# Altium schematic sheet ESP32.SchDoc
size A4; SheetNumber: 7; SheetTotal: 7
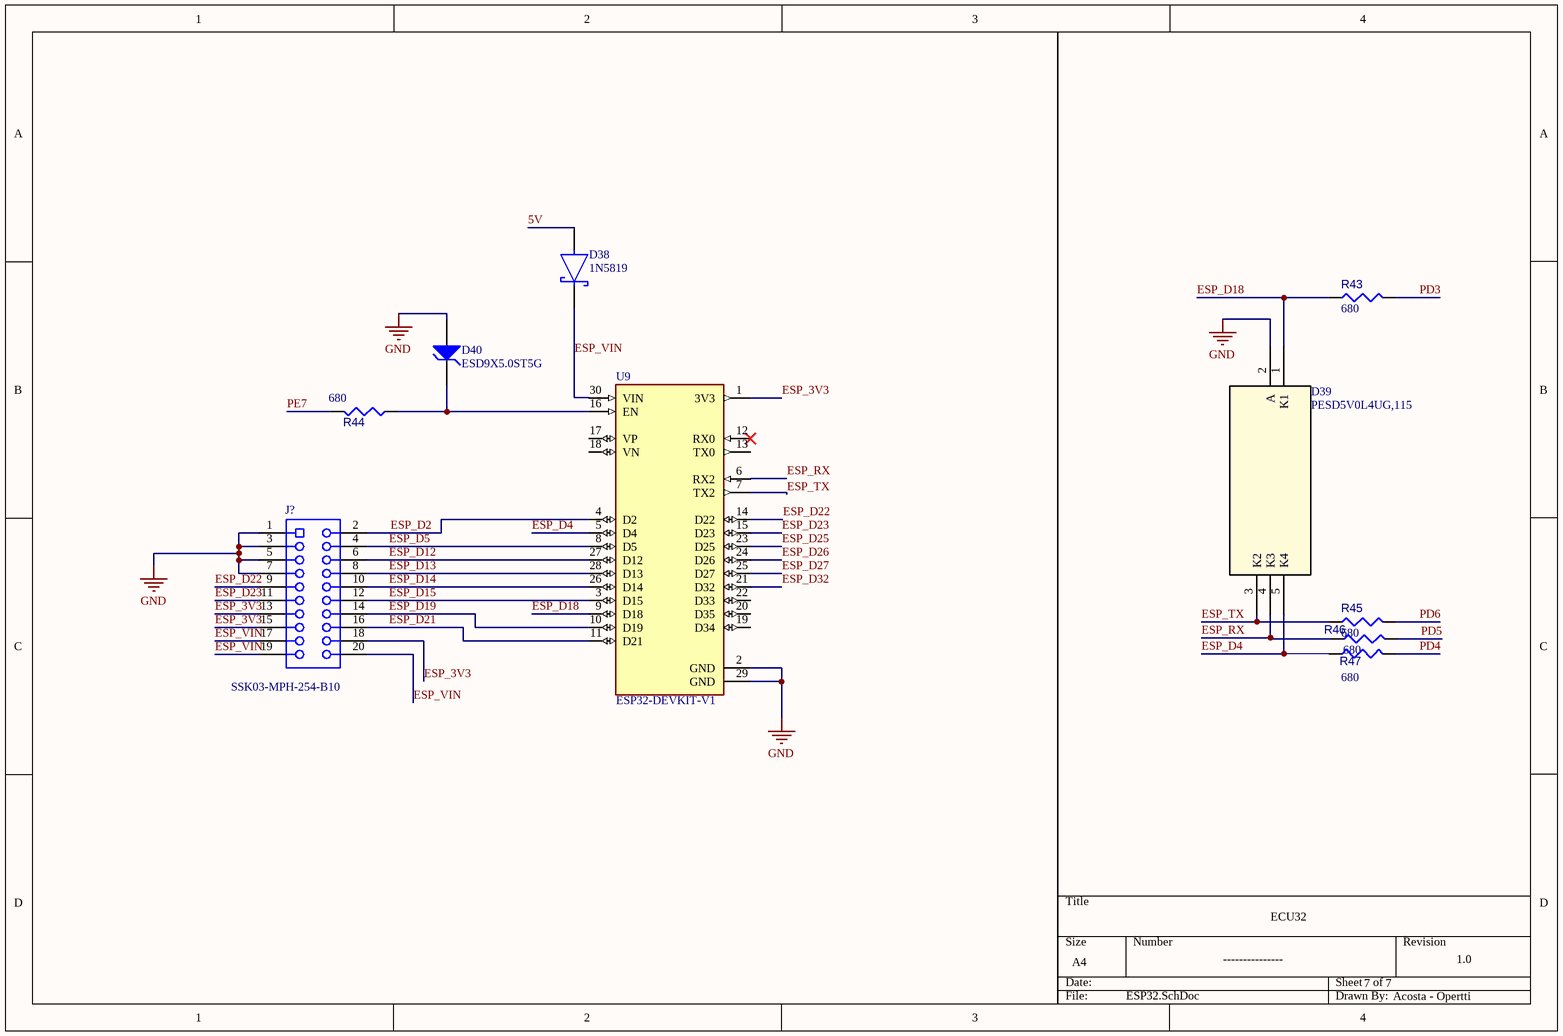
[diagram p0: ESP32.SchDoc]

## Parts
D38  1N5819  [FP-SMA-MFG]
D39  PESD5V0L4UG,115  [PESD5V0L4UG,115-Footprint-1]
D40  ESD9X5.0ST5G  [ONSC-SOD-923-2-514AA-01_V]
J?  SSK03-MPH-254-B10  [SAMESKY_SSK03-MPH-254-B10]
R43  value 680  [RESA60-630X240]  (hidden comment: MFR-25FBF52-47R5)
R44  value 680  [RESA60-630X240]  (hidden comment: MFR-25FBF52-47R5)
R45  value 680  [RESA60-630X240]  (hidden comment: MFR-25FBF52-47R5)
R46  value 680  [RESA60-630X240]  (hidden comment: MFR-25FBF52-47R5)
R47  value 680  [RESA60-630X240]  (hidden comment: MFR-25FBF52-47R5)
U9  ESP32-DEVKIT-V1  [MODULE_ESP32_DEVKIT_V1]

## Nets
GND: D39.2(A) D40.2(A) J?.1 J?.3 J?.5 J?.7 U9.2(GND) U9.29(GND)
5V: D38.2(A)
ESP_3V3: J?.13 J?.15 J?.18 U9.1(3V3)
ESP_D2: J?.2 U9.4(D2)
ESP_D4: D39.5(K4) R47.1 U9.5(D4)
ESP_D5: J?.4 U9.8(D5)
ESP_D12: J?.6 U9.27(D12)
ESP_D13: J?.8 U9.28(D13)
ESP_D14: J?.10 U9.26(D14)
ESP_D15: J?.12 U9.3(D15)
ESP_D18: D39.1(K1) R43.1 U9.9(D18)
ESP_D19: J?.14 U9.10(D19)
ESP_D21: J?.16 U9.11(D21)
ESP_D22: J?.9 U9.14(D22)
ESP_D23: J?.11 U9.15(D23)
ESP_D25: U9.23(D25)
ESP_D26: U9.24(D26)
ESP_D27: U9.25(D27)
ESP_D32: U9.21(D32)
ESP_RX: D39.4(K3) R46.1 U9.6(RX2)
ESP_TX: D39.3(K2) R45.1 U9.7(TX2)
ESP_VIN: D38.1(C) J?.17 J?.19 J?.20 U9.30(VIN)
PD3: R43.2
PD4: R47.2
PD5: R46.2
PD6: R45.2
PE7: R44.1
NetD40_1: D40.1(K) R44.2 U9.16(EN)

Not connected (* = marked no-connect by the designer): U9 12(RX0)* 13(TX0) 17(VP) 18(VN) 19(D34) 20(D35) 22(D33)

## Notes on the sheet
- ECU32
- ---------------
- 7
- 1.0
- Acosta - Opertti

## Library data of the parts
D38 = CMP-1667-00003-3: DIODE SCHOTTKY 40V 1A; Max Forward Surge Current (Ifsm): 80A; Output Current: 3A; Forward Voltage: 500mV; Polarity: Standard; Max Reverse Current: 500uA; Capacitance: 250pF; Element Configuration: Single; Mount: Surface Mount; Radiation Hardening: No; Width: 2.92mm; Current Rating: 3A; Termination: SMD/SMT; Voltage: 40V; Series: -; Max Operating Temperature: 125°C; Current: 3A; Max Repetitive Reverse Voltage (Vrrm): 40V; Min Operating Temperature: -55°C; REACH SVHC: No SVHC; Number of Pins: 2; Average Rectified Current: 3A; Contact Plating: Tin; RoHS Compliant: Yes; Max Reverse Voltage (DC): 40V; Packaging: Tape and Reel; Height: 2.3mm; Length: 4.6mm; Case/Package: SMA; Weight: 0.002258oz; Peak Non-Repetitive Surge Current: 80A; Package Quantity: 5000; Lead Free: Lead Free; Forward Current: 3A; Voltage Rating (DC): 40V
D39 = PESD5V0L4UG,115-1: Tvs Diodes & Esd Suppressors; PESD5V0L4UG, 115; Nexperia; 5 V; 5; 13 V; 6.8 V; Manufacturer Lifecycle Status: RELEASED FOR SUPPLY; Max Junction Temperature (Tj): 150°C; Working Voltage: 5V; ESD Protection: Yes; Number of Elements: 4; Peak Reverse Current: 25nA; Clamping Voltage: 13V; Direction: Unidirectional; Value: 16pF; Max Surge Current: 2.5A; Test Current: 1mA; Max Power Dissipation: 300mW; Breakdown Voltage: 6.8V; Ratings: AEC-Q101, MIL-STD-883; Max Breakdown Voltage: 7.14V; Peak Pulse Power: 30W; Min Breakdown Voltage: 6.46V; Element Configuration: Common Anode; Power Line Protection: No; Case/Package: SOT-353; China RoHS: Compliant; Country of Origin: Malaysia; Ambient Temperature Range High: 150°C; Introduction Date: 2004-03-24; Mounting Technology: Surface Mount; Max Reverse Leakage Current: 25nA; Number of Channels: 4; Number of Terminals: 5; Operating Supply Voltage: 5V; Radiation Hardening: No; Schedule B: 8536300000, 8541100050, 8541100050; Peak Pulse Current: 2.5A; Harmonized Tariff Schedule (HTS) Code: 8541.10.00.50; Width: 1.35mm; Lifecycle Status: Production; Height: 1.1mm; Number of Unidirectional Channels: 4; Termination: SMD/SMT; Leakage Current: 25nA; Length: 2.2mm; Export Control Classification Number (ECCN) Code: EAR99; Min Operating Temperature: -65°C; Max Operating Temperature: 150°C; Reverse Standoff Voltage: 5V; Contact Plating: Tin; Composition: Zener; Depth: 1.35mm; REACH SVHC: Unaffected; Lead Free: Lead Free; Pins: 5; Weight: 4.535924g; Packaging: Cut Tape; RoHS: Compliant; Polarity: Unidirectional
D40 = CMP-1063-00108-1: Transient Voltage Suppressor, Micro-Packaged Diode for ESD Protection, 2-Pin SOD-923, Pb-Free, Tape and Reel; Manufacturer: On Semiconductor; V(BR) Min (V): 6.2; VRWM Max (V): 5; Number of Lines: 1; Direction: Unidirectional; Mounting Technology: Surface Mount; PackageReference: SOD-923-2-514AA-01; RoHS: Pb-Free; PackageDescription: 2-Pin SOD, Body 0.8 x 0.6 mm; PartNumber: ESD9X5.0ST5G; IR Max (uA): 1; ComponentLink3Description: Package Specification; DatasheetVersion: Rev. 7; Packing: Tape and Reel; PackageVersion: Rev. E, 03/2011; ComponentLink3URL: http://www.onsemi.com/pub_link/Collateral/514AA.PDF; ComponentLink2Description: Datasheet; ComponentLink2URL: http://www.onsemi.cn/pub_link/Collateral/ESD9X3.3ST5G-D.PDF; ComponentLink1Description: Manufacturer URL; ComponentLink1URL: http://www.onsemi.com/
J? = CMP-002-00074-2: 2.54MM MALE HEADER 2X10PIN, STRA; MF: Same Sky (Formerly CUI Devices); Design Item ID: SSK03-MPH-254-B10; Case/Package: None; Pins: 20; Value: *; MP: SSK03-MPH-254-B10; Component Type: Standard; SnapEDA_Link: https://www.snapeda.com/parts/SSK03-MPH-254-B10/Same+Sky/view-part/?ref=snap; Source: SSK03-MPH-254-B10.SchLib; Check_prices: https://www.snapeda.com/parts/SSK03-MPH-254-B10/Same+Sky/view-part/?ref=eda
R43-R47 = CMP-009-00058-4: Axial Resistor, 47.5 Ohm, +/- 1%, 0.25 W, -55 to 155 degC, 2-Pin THD, RoHS, Bulk; Manufacturer: Yageo; Voltage Rating: 250V; Power: 250mW; Packaging: Bulk; Package Description: 2-Pin Axial Lead, Dia 2.4 mm, Body Length 6.3 mm; Package Reference: MFR-25; Case/Package: Axial; Tolerance: 1%; RoHS Compliant: True; Package Quantity: 200; Max Operating Temperature: 155°C; Manufacturer URL: http://www.yageo.com/; Datasheet URL: http://www.yageo.com/documents/recent/Yageo%20LR_MFR_2013.pdf; Min Operating Temperature: -55°C; Datasheet Version: Apr-13; Mounting Technology: TH
U9 = CMP-031-000000-1: Dual core, Wi-Fi: 2.4 GHz up to 150 Mbits/s,BLE (Bluetooth Low Energy) and legacy Bluetooth, 32 bits, Up to 240 MHz; MF: Do it; Source: ESP32-DEVKIT-V1.SchLib; Package: None; SnapEDA_Link: https://www.snapeda.com/parts/ESP32-DEVKIT-V1/Do+it/view-part/?ref=snap; Pin Count: 30; Design Item ID: ESP32-DEVKIT-V1; Check_prices: https://www.snapeda.com/parts/ESP32-DEVKIT-V1/Do+it/view-part/?ref=eda; MP: ESP32-DEVKIT-V1; Value: *; Component Type: Standard